# EasyEDA Pro project CAN Bus IO Module.epro, schematic Schematic1
Board Name: Board1; Create Date: 2026-04-16; Page Name: P1; Project Name: PCB_PCB_Automotive-Dashboard_2025-10-05; Schematic Name: Schematic1; Update Date: 2026-04-15; Company: EasyEDA.com; Page Size: A4; Version: V1.0
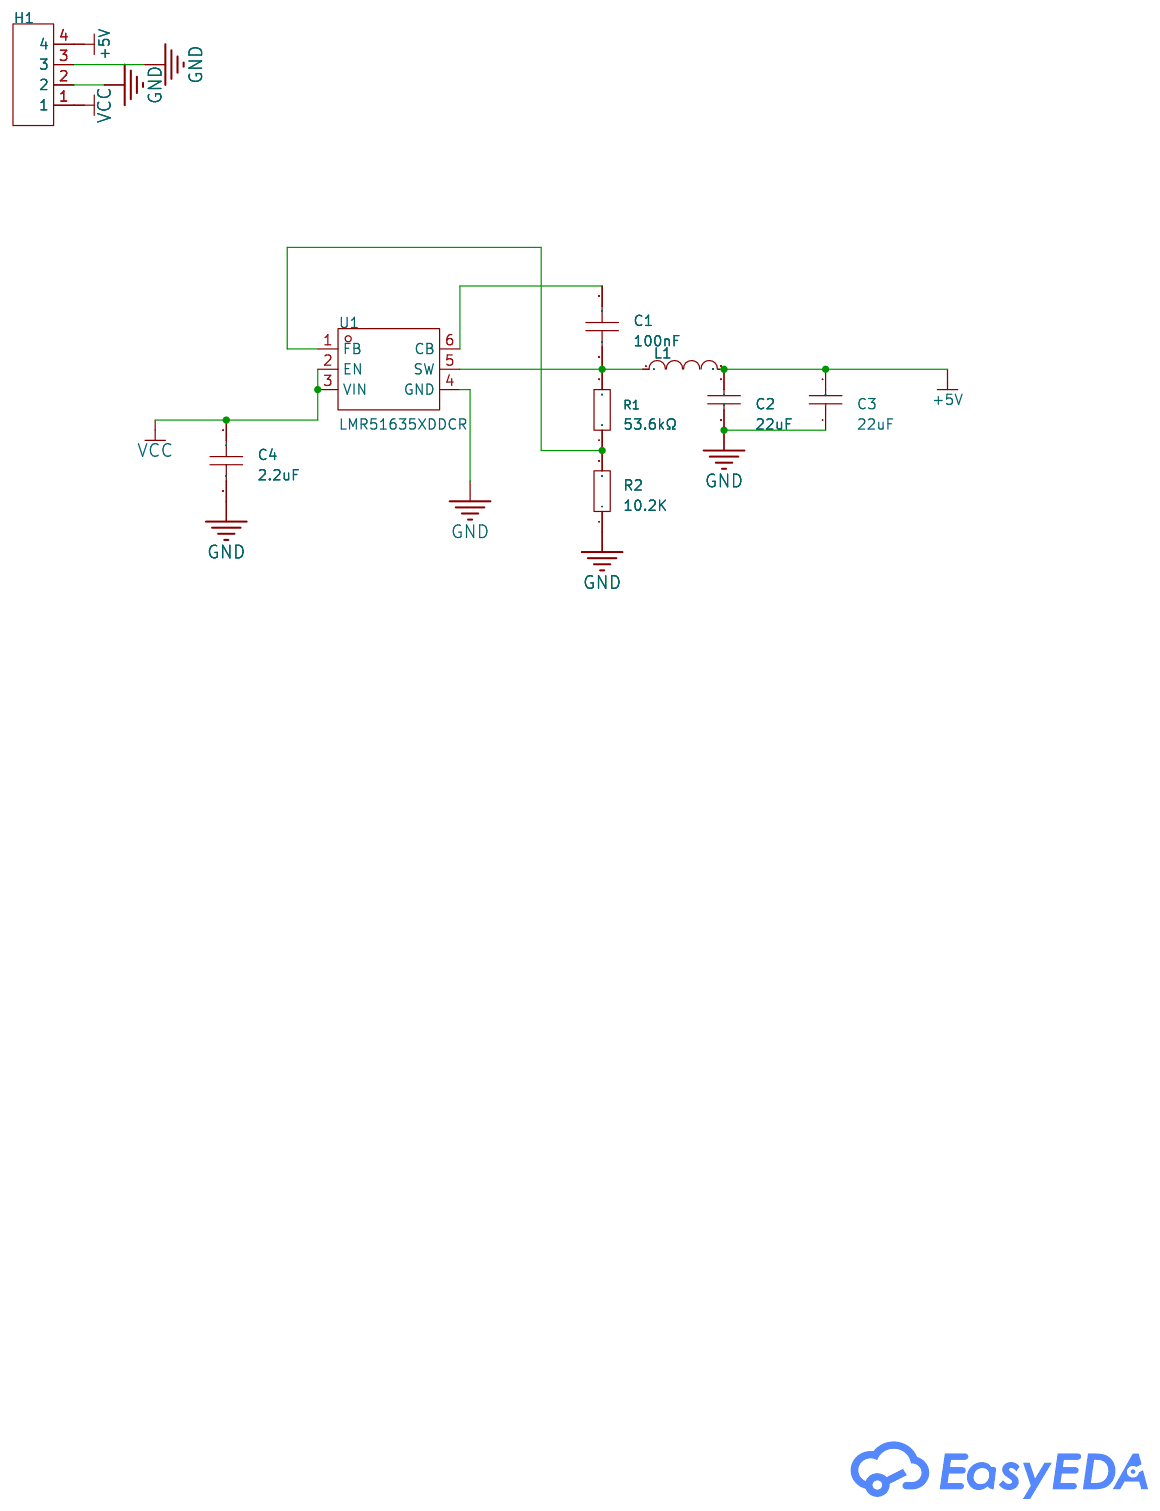
[diagram p5: schematic sheet]

## Parts
C1  100nF  [C0805]
C2  22uF  [C0805]
C3  22uF  [C0805]
C4  2.2uF  [C0805]
H1  -  [HDR-TH_4P-P2.54-V-M]
L1  10uH  [IND-SMD_L8.0-W8.0]
R1  53.6kΩ  [R0805]
R2  10.2K  [R0805]
U1  LMR51635XDDCR  [SOT-23-6_L2.9-W1.6-P0.95-LS2.8-BR]

## Library data of the parts
C1 = CC0805KRX7R9BB104: Capacitance:100nF Tolerance:±10% Tolerance:±10% Voltage Rating:50V Temperature Coefficient:X7R; LCSC Part Name: 100nF ±10% 50V; Supplier Part: C49678; Manufacturer: YAGEO(国巨); Supplier Footprint: 0805; JLCPCB Part Class: Basic Part; Datasheet: https://item.szlcsc.com/datasheet/CC0805KRX7R9BB104/50686.html; Supplier: LCSC; Tolerance: ±10%; Voltage Rating: 50V; Temperature Coefficient: X7R
C2 C3 = CC0805MKX5R8BB226: Capacitance:22uF Tolerance:±20% Tolerance:±20% Voltage Rating:25V Temperature Coefficient:X5R; LCSC Part Name: 22uF ±20% 25V; Supplier Part: C784585; Manufacturer: YAGEO(国巨); Supplier Footprint: 0805; JLCPCB Part Class: Extended Part; Datasheet: https://item.szlcsc.com/datasheet/CC0805MKX5R8BB226/840648.html; Supplier: LCSC; Tolerance: ±20%; Voltage Rating: 25V; Temperature Coefficient: X5R
C4 = 0805X225K500CT: Capacitance:2.2uF Voltage Rating:50V Temperature Coefficient:X5R; LCSC Part Name: 2.2uF 50V; Supplier Part: C2918683; Manufacturer: Walsin(华新科); Supplier Footprint: 0805; JLCPCB Part Class: Extended Part; Datasheet: https://item.szlcsc.com/datasheet/0805X225K500CT/3220535.html; Supplier: LCSC; Voltage Rating: 50V; Temperature Coefficient: X5R
H1 = HDR-M_2.54_1x4P: Supplier Footprint: Through
L1 = YNR8040-100M: Inductance:10uH Tolerance:±20% Tolerance:±20% Current Rating:3.3A DC Resistance(DCR):29mΩ Type:Magnetic Shielded Inductor; LCSC Part Name: 10uH ±20%; Supplier Part: C341077; Manufacturer: YJYCOIN(益嘉源); Supplier Footprint: SMD,8x8mm; JLCPCB Part Class: Extended Part; Datasheet: https://item.szlcsc.com/datasheet/YNR8040-100M/318294.html; Supplier: LCSC; Tolerance: ±20%; Current Rating: 3.3A; DC Resistance(DCR): 29mΩ; Type: Magnetic Shielded Inductor
R1 = RMC080553.6K1%N: Type:Thick Film Resistor Resistance:53.6kΩ Tolerance:±1% Tolerance:±1% Power(Watts):125mW Voltage-Supply(Max):150V Temperature Coefficient:±100ppm/℃ Temperature Coefficient:±100ppm/℃ Operating Temperature:-55℃~+155℃ Operating Temperature:-55℃~+155℃; LCSC Part Name: 厚膜电阻 53.6kΩ ±1% 125mW; Supplier Part: C325872; Manufacturer: Tyohm(幸亚电阻); Supplier Footprint: 0805; JLCPCB Part Class: Extended Part; Datasheet: https://item.szlcsc.com/datasheet/RMC080553.6K1%2525N/306077.html; Supplier: LCSC; Type: Thick Film Resistor; Tolerance: ±1%; Power(Watts): 125mW; Voltage-Supply(Max): 150V; Temperature Coefficient: ±100ppm/℃; Operating Temperature: -55℃~+155℃
R2 = Res_0805: Supplier Footprint: 0805
U1 = LMR51635XDDCR: Supplier Part: C42432812; Manufacturer: TI(德州仪器); Supplier Footprint: TSOT-23-6; JLCPCB Part Class: Extended Part; Datasheet: https://www.ti.com.cn/cn/lit/ds/symlink/lmr51635.pdf?ts=1735634434869&ref_url=https%253A%252F%252Fwww.ti.com.cn%252Fsitesearch%252Fzh-cn%252Fdocs%252Funiversalsearch.tsp%253FlangPref%253Dzh-CN%2526searchTerm%253DLMR51635XDDCR%2526nr%253D8; Supplier: LCSC

## Nets
+5V: C2.2 C3.2 H1.4 L1.2
GND: C2.1 C3.1 C4.2 H1.2 H1.3 R2.1 U1.4(GND)
VCC: C4.1 H1.1 U1.2(EN) U1.3(VIN)
$1N624: R1.1 R2.2 U1.1(FB)
$1N674: C1.1 L1.1 R1.2 U1.5(SW)
$1N677: C1.2 U1.6(CB)
